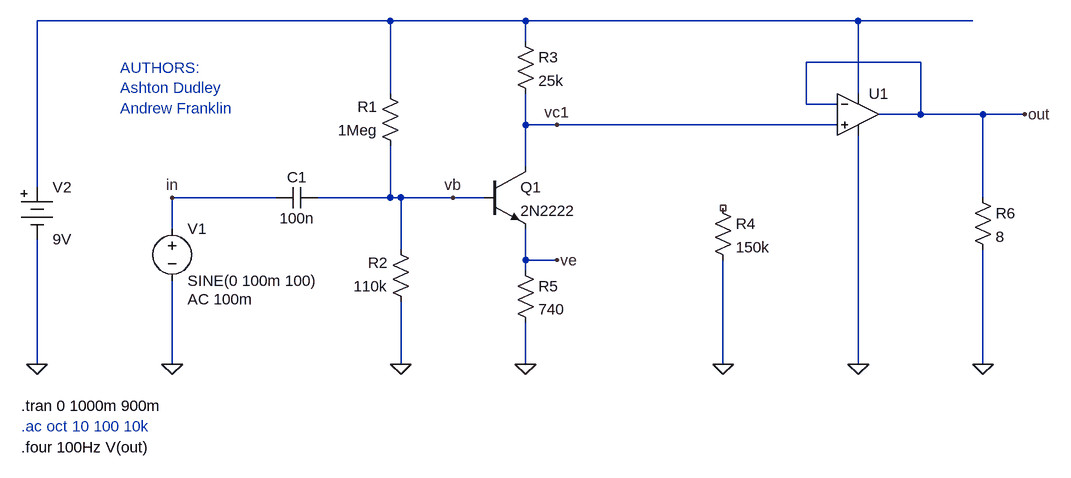
[diagram p0: schematic Guitar Pedal 261015-1 - L3 with Buffer.asc]
Guitar Pedal 261015-1 - L3 with Buffer.asc, the LTspice schematic file:
Version 4.1
SHEET 1 1224 720
WIRE 0 -144 -544 -144
WIRE 208 -144 0 -144
WIRE 720 -144 208 -144
WIRE 896 -144 720 -144
WIRE 208 -112 208 -144
WIRE 816 -80 640 -80
WIRE 0 -32 0 -144
WIRE 720 -32 720 -144
WIRE 640 -16 640 -80
WIRE 688 -16 640 -16
WIRE 816 0 816 -80
WIRE 816 0 752 0
WIRE 912 0 816 0
WIRE 976 0 912 0
WIRE 208 16 208 -32
WIRE 256 16 208 16
WIRE 688 16 256 16
WIRE 208 80 208 16
WIRE -544 112 -544 -144
WIRE -176 128 -336 128
WIRE 0 128 0 48
WIRE 0 128 -112 128
WIRE 16 128 0 128
WIRE 96 128 16 128
WIRE 144 128 96 128
WIRE 912 128 912 0
WIRE -336 176 -336 128
WIRE 16 208 16 128
WIRE 208 224 208 176
WIRE 256 224 208 224
WIRE 208 240 208 224
WIRE -544 384 -544 192
WIRE -336 384 -336 256
WIRE 16 384 16 288
WIRE 208 384 208 320
WIRE 512 384 512 224
WIRE 720 384 720 32
WIRE 912 384 912 208
FLAG 16 384 0
FLAG 512 384 0
FLAG -336 128 in
FLAG -336 384 0
FLAG 208 384 0
FLAG -544 384 0
FLAG 256 224 ve
FLAG 256 16 vc1
FLAG 96 128 vb
FLAG 976 0 out
FLAG 912 384 0
FLAG 720 384 0
SYMBOL npn 144 80 R0
SYMATTR InstName Q1
SYMATTR Value 2N2222
SYMBOL res 16 64 R180
WINDOW 0 36 76 Left 2
WINDOW 3 36 40 Left 2
SYMATTR InstName R1
SYMATTR Value 1Meg
SYMBOL res 32 304 R180
WINDOW 0 36 76 Left 2
WINDOW 3 36 40 Left 2
SYMATTR InstName R2
SYMATTR Value 110k
SYMBOL voltage -336 160 R0
WINDOW 123 24 124 Left 2
WINDOW 39 0 0 Left 0
SYMATTR Value2 AC 100m
SYMATTR InstName V1
SYMATTR Value SINE(0 100m 100)
SYMBOL Misc\\battery -544 96 R0
WINDOW 123 0 0 Left 0
WINDOW 39 0 0 Left 0
SYMATTR InstName V2
SYMATTR Value 9V
SYMBOL cap -112 112 R90
WINDOW 0 0 32 VBottom 2
WINDOW 3 32 32 VTop 2
SYMATTR InstName C1
SYMATTR Value 100n
SYMBOL res 192 -128 R0
SYMATTR InstName R3
SYMATTR Value 25k
SYMBOL res 496 128 R0
SYMATTR InstName R4
SYMATTR Value 150k
SYMBOL res 192 224 R0
SYMATTR InstName R5
SYMATTR Value 740
SYMBOL res 896 112 R0
SYMATTR InstName R6
SYMATTR Value 8
SYMBOL OpAmps\\UniversalOpAmp 720 0 R0
SYMATTR InstName U1
TEXT -568 448 Left 2 !.tran 0 1000m 900m
TEXT -568 480 Left 2 ;.ac oct 10 100 10k
TEXT -568 512 Left 2 !.four 100Hz V(out)
TEXT -416 -72 Left 2 ;AUTHORS:\nAshton Dudley\nAndrew Franklin

The netlist it stands for:
* Guitar Pedal 261015-1 - L3 with Buffer.asc
Q1 vc1 vb ve 0 2N2222
R1 vb N001 1Meg
R2 0 vb 110k
V1 in 0 SINE(0 100m 100) AC 100m
V2 N001 0 9V
C1 vb in 100n
R3 N001 vc1 25k
R4 NC_01 0 150k
R5 ve 0 740
R6 out 0 8
X§U1 vc1 out N001 0 out level1 Avol=1Meg GBW=10Meg Vos=0 En=0 Enk=0 In=0 Ink=0 Rin=500Meg  ; pins In+ In- V+ V- OUT
.model NPN NPN
.model PNP PNP
.lib standard.bjt
.tran 0 1000m 900m
* .ac oct 10 100 10k
.four 100Hz V(out)
* AUTHORS:
* Ashton Dudley
* Andrew Franklin
.lib UniversalOpAmp1.lib
.backanno
.end